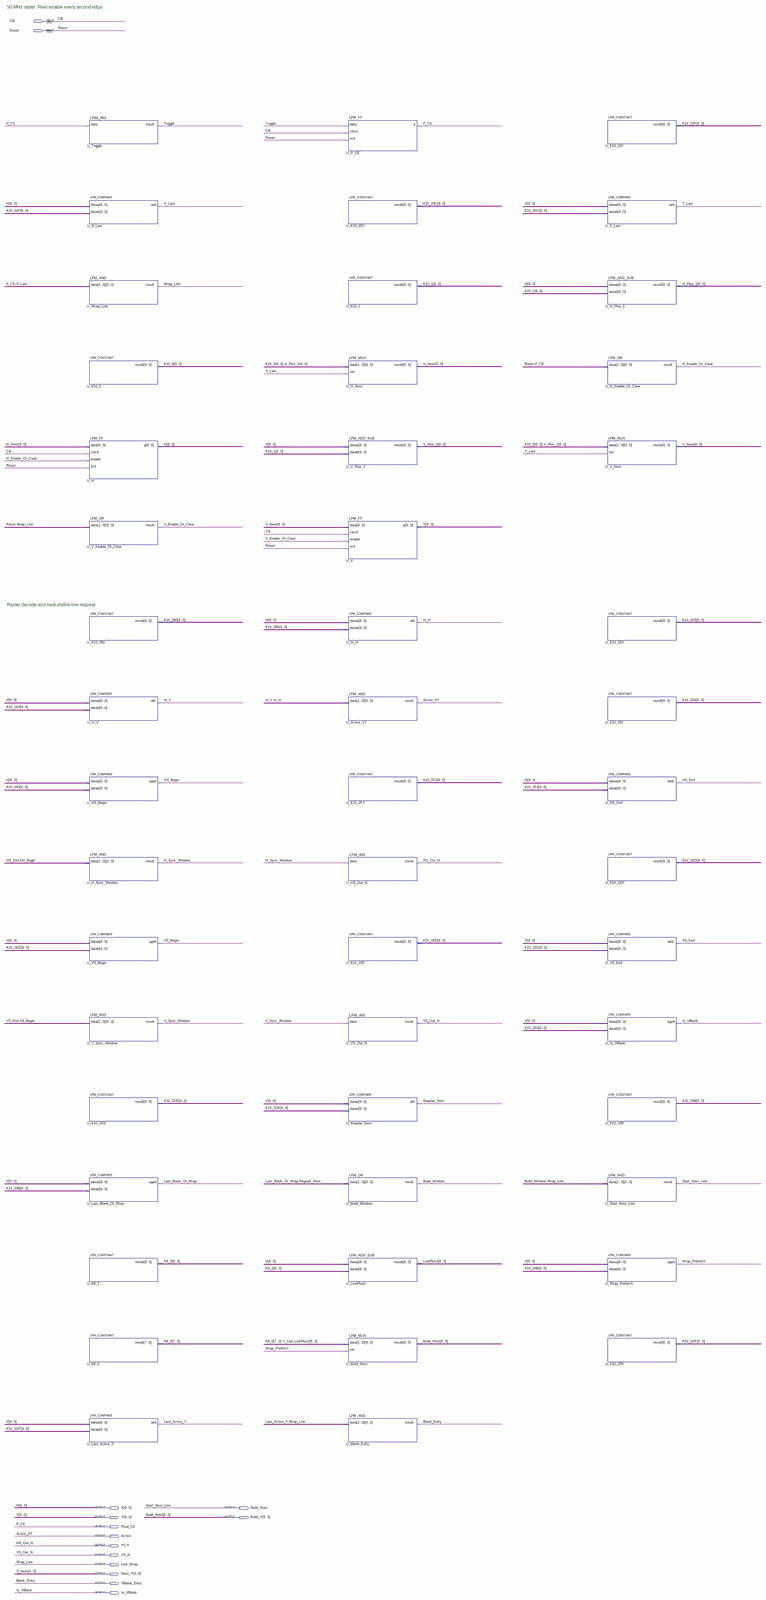
[diagram p0: schematic sheet, whole]
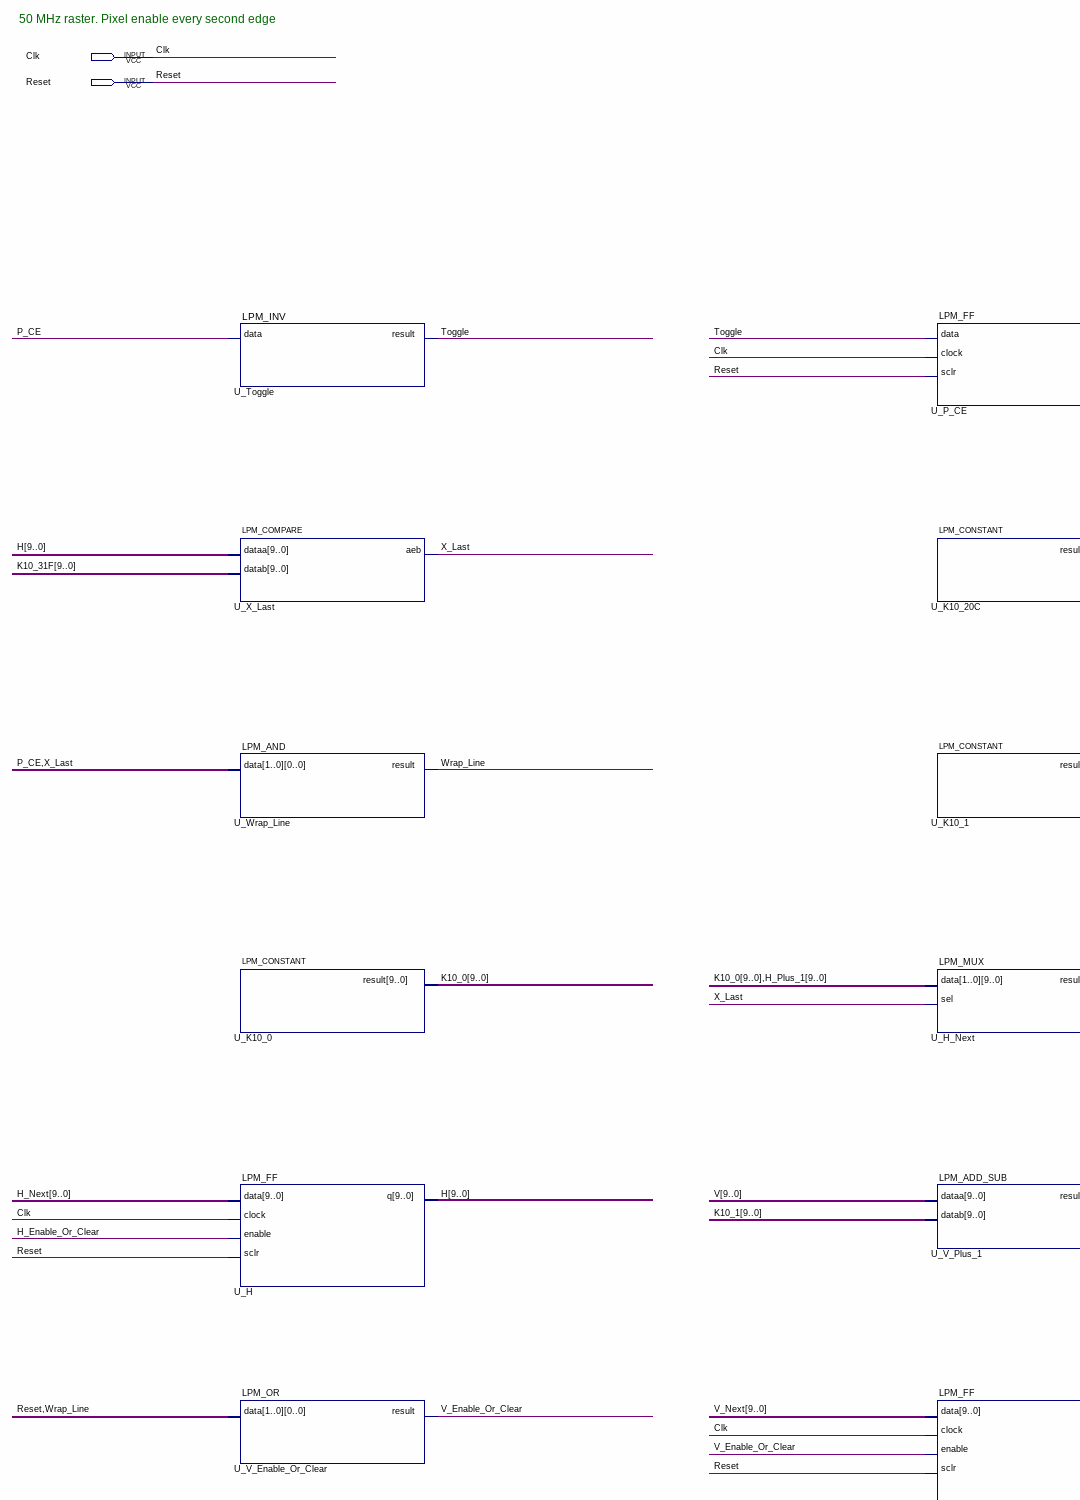
[diagram p1: schematic sheet, upper left part]
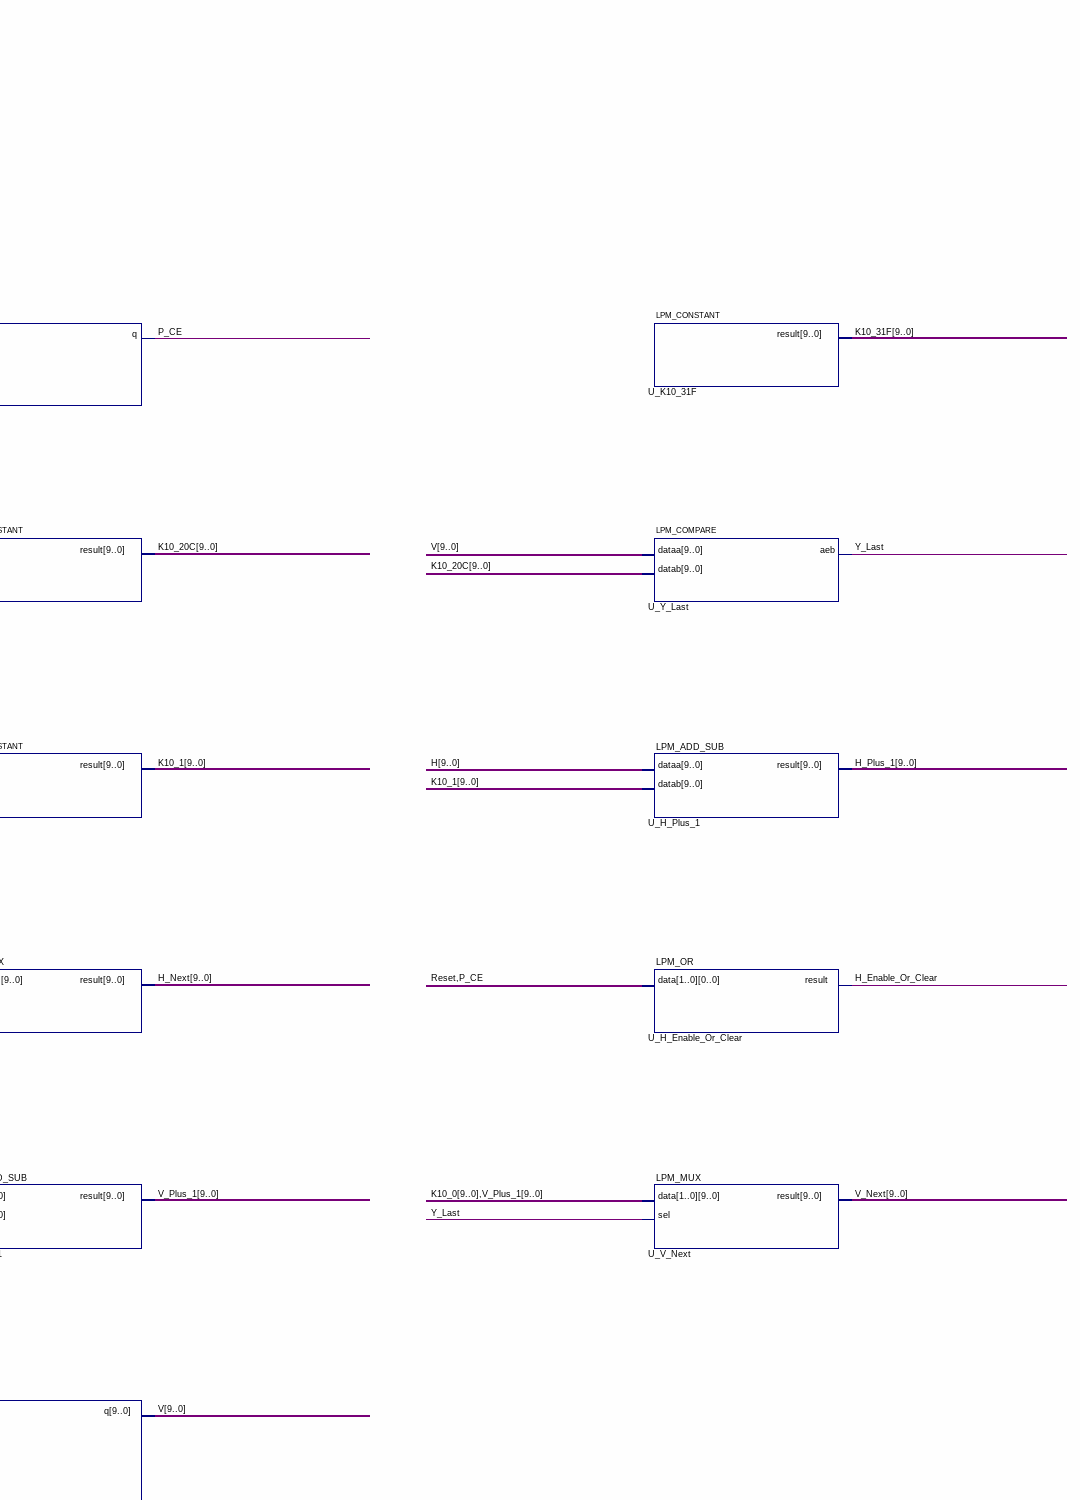
[diagram p2: schematic sheet, upper right part]
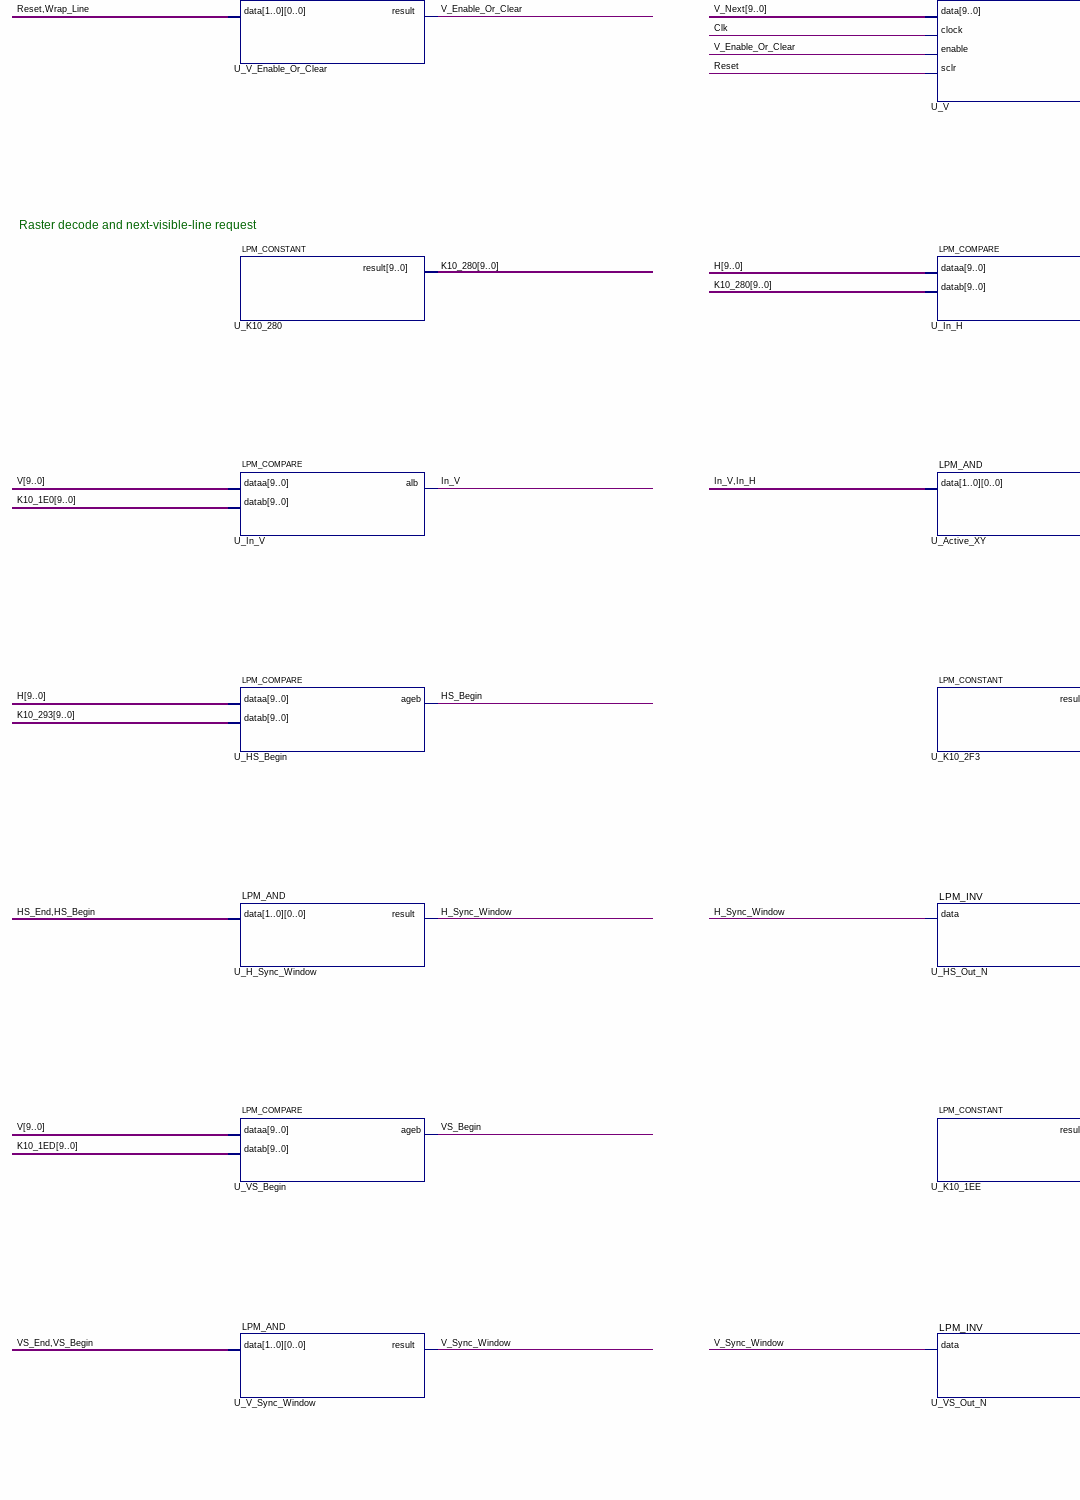
[diagram p3: schematic sheet, middle left part]
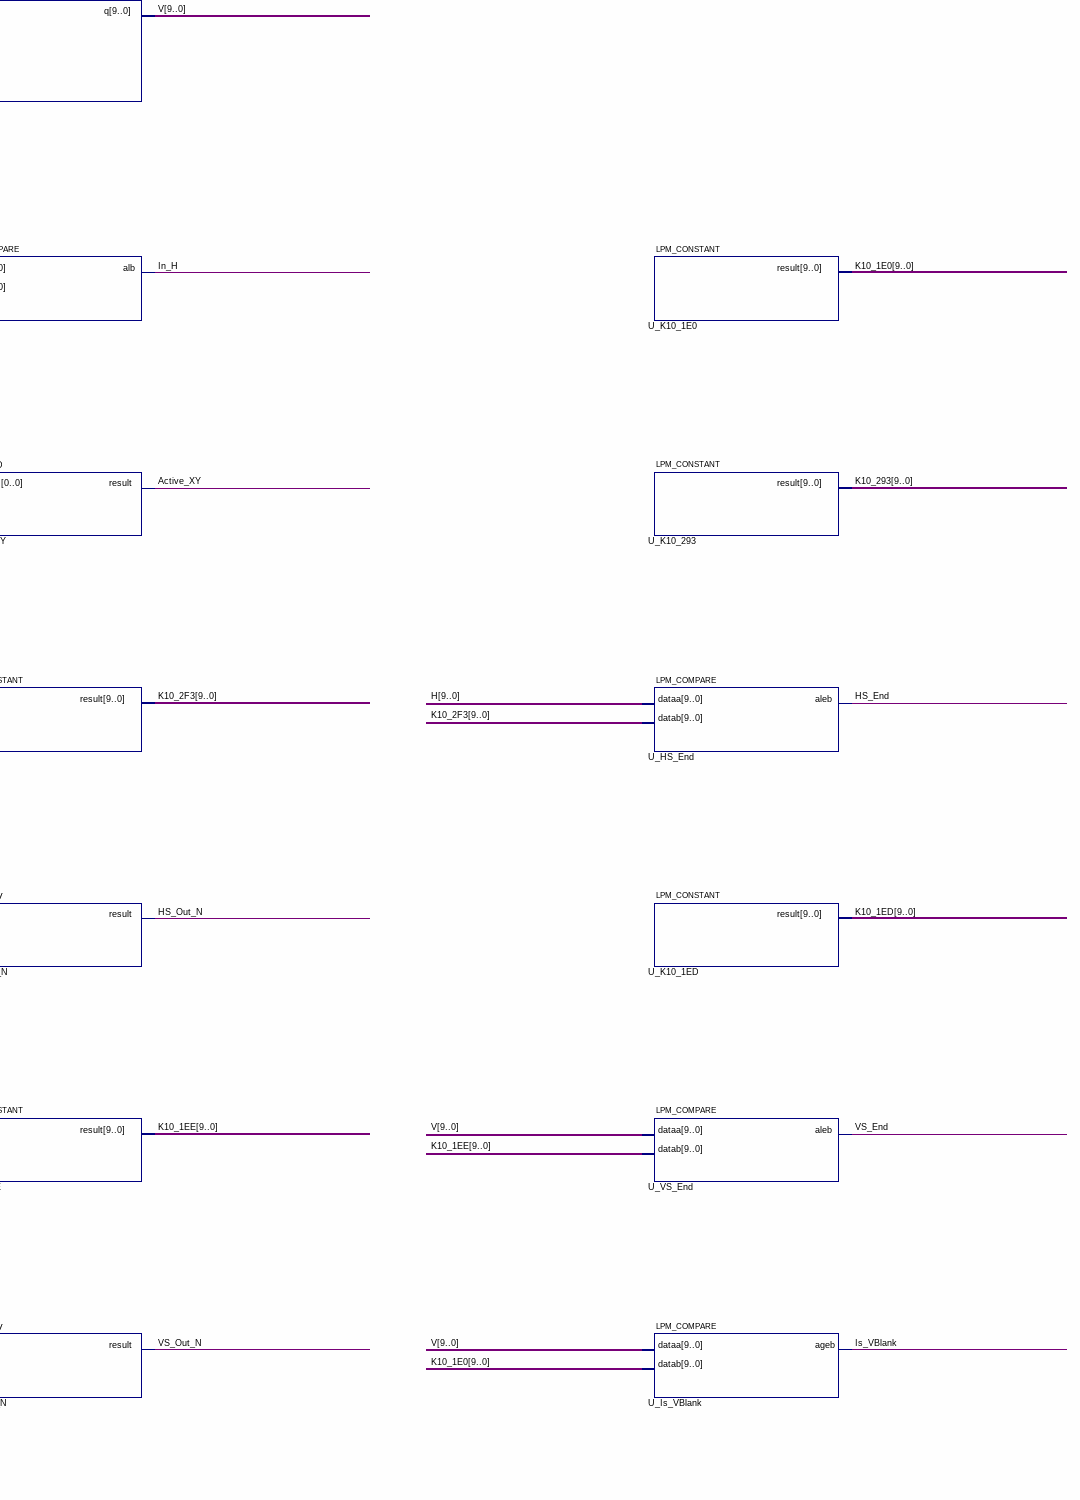
[diagram p4: schematic sheet, middle right part]
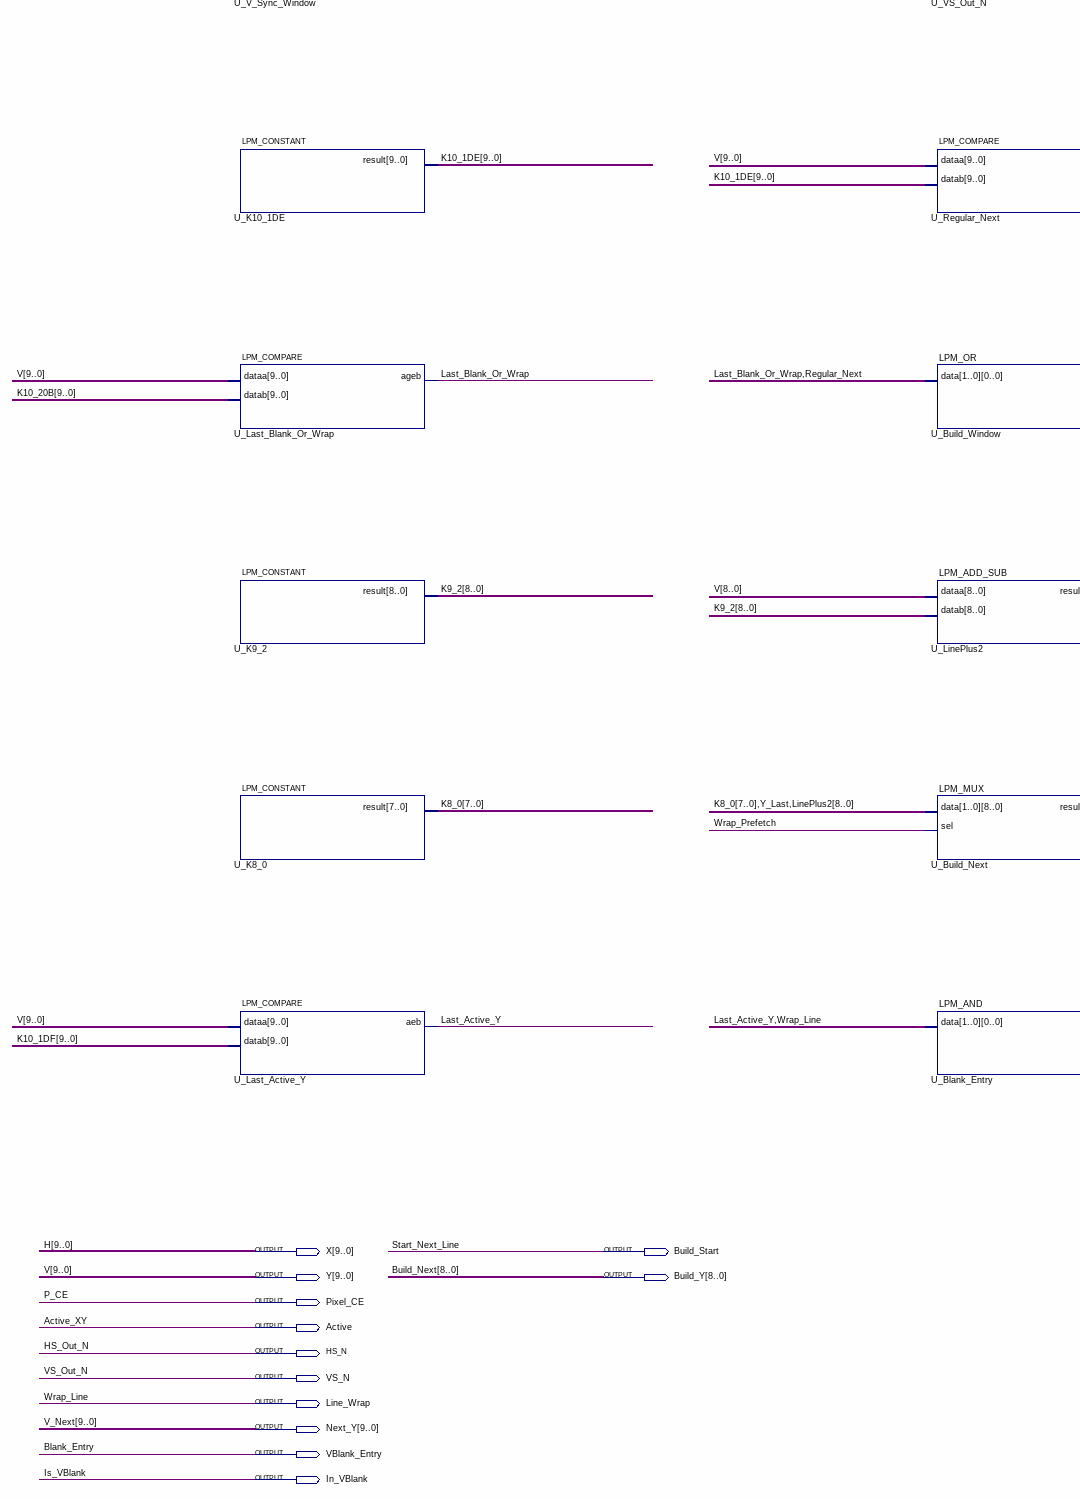
[diagram p5: schematic sheet, lower left part]
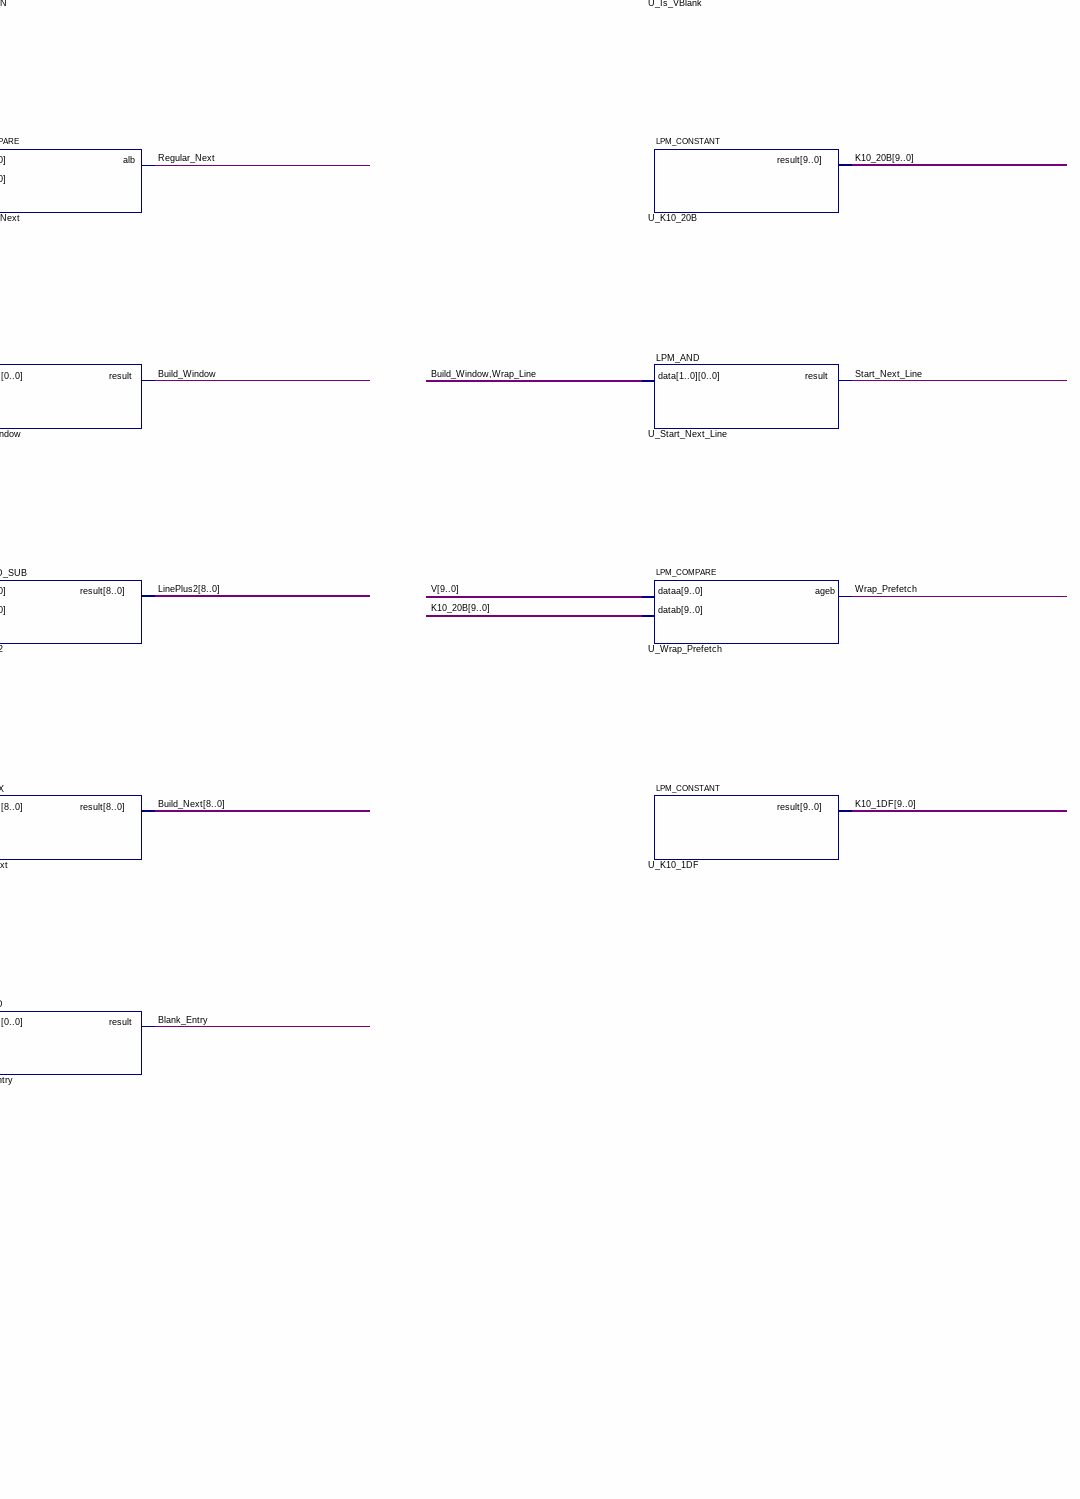
[diagram p6: schematic sheet, lower right part]
// Quartus schematic Raster_Timing.bdf as structural Verilog: 49 symbols, 14 pins
module Raster_Timing (
  input  Clk,
  input  Reset,
  output [9:0] X,
  output Build_Start,
  output [9:0] Y,
  output [8:0] Build_Y,
  output Pixel_CE,
  output Active,
  output HS_N,
  output VS_N,
  output Line_Wrap,
  output [9:0] Next_Y,
  output VBlank_Entry,
  output In_VBlank
);

  wire Build_Window, H_Enable_Or_Clear, H_Sync_Window, HS_Begin, HS_End, In_H, In_V, Last_Active_Y,
       Last_Blank_Or_Wrap, Regular_Next, Toggle, V_Enable_Or_Clear, V_Sync_Window, VS_Begin, VS_End,
       Wrap_Prefetch, X_Last, Y_Last;
  wire [7:0] K8_0;
  wire [8:0] K9_2, LinePlus2;
  wire [9:0] H_Next, H_Plus_1, K10_0, K10_1, K10_1DE, K10_1DF, K10_1E0, K10_1ED, K10_1EE, K10_2F3, K10_20B,
       K10_20C, K10_31F, K10_280, K10_293, V_Plus_1;

  LPM_INV #(.LPM_WIDTH(1)) U_Toggle (.data(Pixel_CE), .result(Toggle));
  LPM_COMPARE #(.LPM_WIDTH(10), .LPM_REPRESENTATION("UNSIGNED")) U_X_Last (.dataa(X), .datab(K10_31F), .aeb(X_Last));
  LPM_AND #(.LPM_WIDTH(1), .LPM_SIZE(2)) U_Wrap_Line (.data({Pixel_CE, X_Last}), .result(Line_Wrap));
  LPM_CONSTANT #(.LPM_WIDTH(10), .LPM_CVALUE(0)) U_K10_0 (.result(K10_0));
  LPM_FF #(.LPM_WIDTH(10), .LPM_FFTYPE("DFF")) U_H (
    .data(H_Next), .clock(Clk), .enable(H_Enable_Or_Clear), .sclr(Reset), .q(X));
  LPM_OR #(.LPM_WIDTH(1), .LPM_SIZE(2)) U_V_Enable_Or_Clear (.data({Reset, Line_Wrap}), .result(V_Enable_Or_Clear));
  LPM_CONSTANT #(.LPM_WIDTH(10), .LPM_CVALUE(640)) U_K10_280 (.result(K10_280));
  LPM_COMPARE #(.LPM_WIDTH(10), .LPM_REPRESENTATION("UNSIGNED")) U_In_V (.dataa(Y), .datab(K10_1E0), .alb(In_V));
  LPM_COMPARE #(.LPM_WIDTH(10), .LPM_REPRESENTATION("UNSIGNED")) U_HS_Begin (
    .dataa(X), .datab(K10_293), .ageb(HS_Begin));
  LPM_AND #(.LPM_WIDTH(1), .LPM_SIZE(2)) U_H_Sync_Window (.data({HS_End, HS_Begin}), .result(H_Sync_Window));
  LPM_COMPARE #(.LPM_WIDTH(10), .LPM_REPRESENTATION("UNSIGNED")) U_VS_Begin (
    .dataa(Y), .datab(K10_1ED), .ageb(VS_Begin));
  LPM_AND #(.LPM_WIDTH(1), .LPM_SIZE(2)) U_V_Sync_Window (.data({VS_End, VS_Begin}), .result(V_Sync_Window));
  LPM_CONSTANT #(.LPM_WIDTH(10), .LPM_CVALUE(478)) U_K10_1DE (.result(K10_1DE));
  LPM_COMPARE #(.LPM_WIDTH(10), .LPM_REPRESENTATION("UNSIGNED")) U_Last_Blank_Or_Wrap (
    .dataa(Y), .datab(K10_20B), .ageb(Last_Blank_Or_Wrap));
  LPM_CONSTANT #(.LPM_WIDTH(9), .LPM_CVALUE(2)) U_K9_2 (.result(K9_2));
  LPM_CONSTANT #(.LPM_WIDTH(8), .LPM_CVALUE(0)) U_K8_0 (.result(K8_0));
  LPM_COMPARE #(.LPM_WIDTH(10), .LPM_REPRESENTATION("UNSIGNED")) U_Last_Active_Y (
    .dataa(Y), .datab(K10_1DF), .aeb(Last_Active_Y));
  LPM_FF #(.LPM_WIDTH(1), .LPM_FFTYPE("DFF")) U_P_CE (.data(Toggle), .clock(Clk), .sclr(Reset), .q(Pixel_CE));
  LPM_CONSTANT #(.LPM_WIDTH(10), .LPM_CVALUE(524)) U_K10_20C (.result(K10_20C));
  LPM_CONSTANT #(.LPM_WIDTH(10), .LPM_CVALUE(1)) U_K10_1 (.result(K10_1));
  LPM_MUX #(.LPM_WIDTH(10), .LPM_SIZE(2), .LPM_WIDTHS(1)) U_H_Next (
    .data({K10_0, H_Plus_1}), .sel(X_Last), .result(H_Next));
  LPM_ADD_SUB #(.LPM_WIDTH(10), .LPM_DIRECTION("ADD"), .LPM_REPRESENTATION("UNSIGNED")) U_V_Plus_1 (
    .dataa(Y), .datab(K10_1), .result(V_Plus_1));
  LPM_FF #(.LPM_WIDTH(10), .LPM_FFTYPE("DFF")) U_V (
    .data(Next_Y), .clock(Clk), .enable(V_Enable_Or_Clear), .sclr(Reset), .q(Y));
  LPM_COMPARE #(.LPM_WIDTH(10), .LPM_REPRESENTATION("UNSIGNED")) U_In_H (.dataa(X), .datab(K10_280), .alb(In_H));
  LPM_AND #(.LPM_WIDTH(1), .LPM_SIZE(2)) U_Active_XY (.data({In_V, In_H}), .result(Active));
  LPM_CONSTANT #(.LPM_WIDTH(10), .LPM_CVALUE(755)) U_K10_2F3 (.result(K10_2F3));
  LPM_INV #(.LPM_WIDTH(1)) U_HS_Out_N (.data(H_Sync_Window), .result(HS_N));
  LPM_CONSTANT #(.LPM_WIDTH(10), .LPM_CVALUE(494)) U_K10_1EE (.result(K10_1EE));
  LPM_INV #(.LPM_WIDTH(1)) U_VS_Out_N (.data(V_Sync_Window), .result(VS_N));
  LPM_COMPARE #(.LPM_WIDTH(10), .LPM_REPRESENTATION("UNSIGNED")) U_Regular_Next (
    .dataa(Y), .datab(K10_1DE), .alb(Regular_Next));
  LPM_OR #(.LPM_WIDTH(1), .LPM_SIZE(2)) U_Build_Window (
    .data({Last_Blank_Or_Wrap, Regular_Next}), .result(Build_Window));
  LPM_ADD_SUB #(.LPM_WIDTH(9), .LPM_DIRECTION("ADD"), .LPM_REPRESENTATION("UNSIGNED")) U_LinePlus2 (
    .dataa(Y[8:0]), .datab(K9_2), .result(LinePlus2));
  LPM_MUX #(.LPM_WIDTH(9), .LPM_SIZE(2), .LPM_WIDTHS(1)) U_Build_Next (
    .data({K8_0, Y_Last, LinePlus2}), .sel(Wrap_Prefetch), .result(Build_Y));
  LPM_AND #(.LPM_WIDTH(1), .LPM_SIZE(2)) U_Blank_Entry (.data({Last_Active_Y, Line_Wrap}), .result(VBlank_Entry));
  LPM_CONSTANT #(.LPM_WIDTH(10), .LPM_CVALUE(799)) U_K10_31F (.result(K10_31F));
  LPM_COMPARE #(.LPM_WIDTH(10), .LPM_REPRESENTATION("UNSIGNED")) U_Y_Last (.dataa(Y), .datab(K10_20C), .aeb(Y_Last));
  LPM_ADD_SUB #(.LPM_WIDTH(10), .LPM_DIRECTION("ADD"), .LPM_REPRESENTATION("UNSIGNED")) U_H_Plus_1 (
    .dataa(X), .datab(K10_1), .result(H_Plus_1));
  LPM_OR #(.LPM_WIDTH(1), .LPM_SIZE(2)) U_H_Enable_Or_Clear (.data({Reset, Pixel_CE}), .result(H_Enable_Or_Clear));
  LPM_MUX #(.LPM_WIDTH(10), .LPM_SIZE(2), .LPM_WIDTHS(1)) U_V_Next (
    .data({K10_0, V_Plus_1}), .sel(Y_Last), .result(Next_Y));
  LPM_CONSTANT #(.LPM_WIDTH(10), .LPM_CVALUE(480)) U_K10_1E0 (.result(K10_1E0));
  LPM_CONSTANT #(.LPM_WIDTH(10), .LPM_CVALUE(659)) U_K10_293 (.result(K10_293));
  LPM_COMPARE #(.LPM_WIDTH(10), .LPM_REPRESENTATION("UNSIGNED")) U_HS_End (.dataa(X), .datab(K10_2F3), .aleb(HS_End));
  LPM_CONSTANT #(.LPM_WIDTH(10), .LPM_CVALUE(493)) U_K10_1ED (.result(K10_1ED));
  LPM_COMPARE #(.LPM_WIDTH(10), .LPM_REPRESENTATION("UNSIGNED")) U_VS_End (.dataa(Y), .datab(K10_1EE), .aleb(VS_End));
  LPM_COMPARE #(.LPM_WIDTH(10), .LPM_REPRESENTATION("UNSIGNED")) U_Is_VBlank (
    .dataa(Y), .datab(K10_1E0), .ageb(In_VBlank));
  LPM_CONSTANT #(.LPM_WIDTH(10), .LPM_CVALUE(523)) U_K10_20B (.result(K10_20B));
  LPM_AND #(.LPM_WIDTH(1), .LPM_SIZE(2)) U_Start_Next_Line (.data({Build_Window, Line_Wrap}), .result(Build_Start));
  LPM_COMPARE #(.LPM_WIDTH(10), .LPM_REPRESENTATION("UNSIGNED")) U_Wrap_Prefetch (
    .dataa(Y), .datab(K10_20B), .ageb(Wrap_Prefetch));
  LPM_CONSTANT #(.LPM_WIDTH(10), .LPM_CVALUE(479)) U_K10_1DF (.result(K10_1DF));

  // Other names for the same wires on the sheet: Active_XY = Active; Blank_Entry = VBlank_Entry;
  //   Build_Next[8:0] = Build_Y; H[9:0] = X; HS_Out_N = HS_N; Is_VBlank = In_VBlank; P_CE = Pixel_CE;
  //   Start_Next_Line = Build_Start; V[9:0] = Y; V_Next[9:0] = Next_Y; VS_Out_N = VS_N; Wrap_Line = Line_Wrap

  // Notes on the sheet:
  //   50 MHz raster. Pixel enable every second edge
  //   Raster decode and next-visible-line request
endmodule
